# Altium schematic sheet Ultrascale+_02.SchDoc: Ultrascale+_02
size A3; Organization: Altium Limited; Address1: L3, 12a Rodborough Rd; Address2: Frenchs Forest; Address3: NSW; Address4: Australia 2086
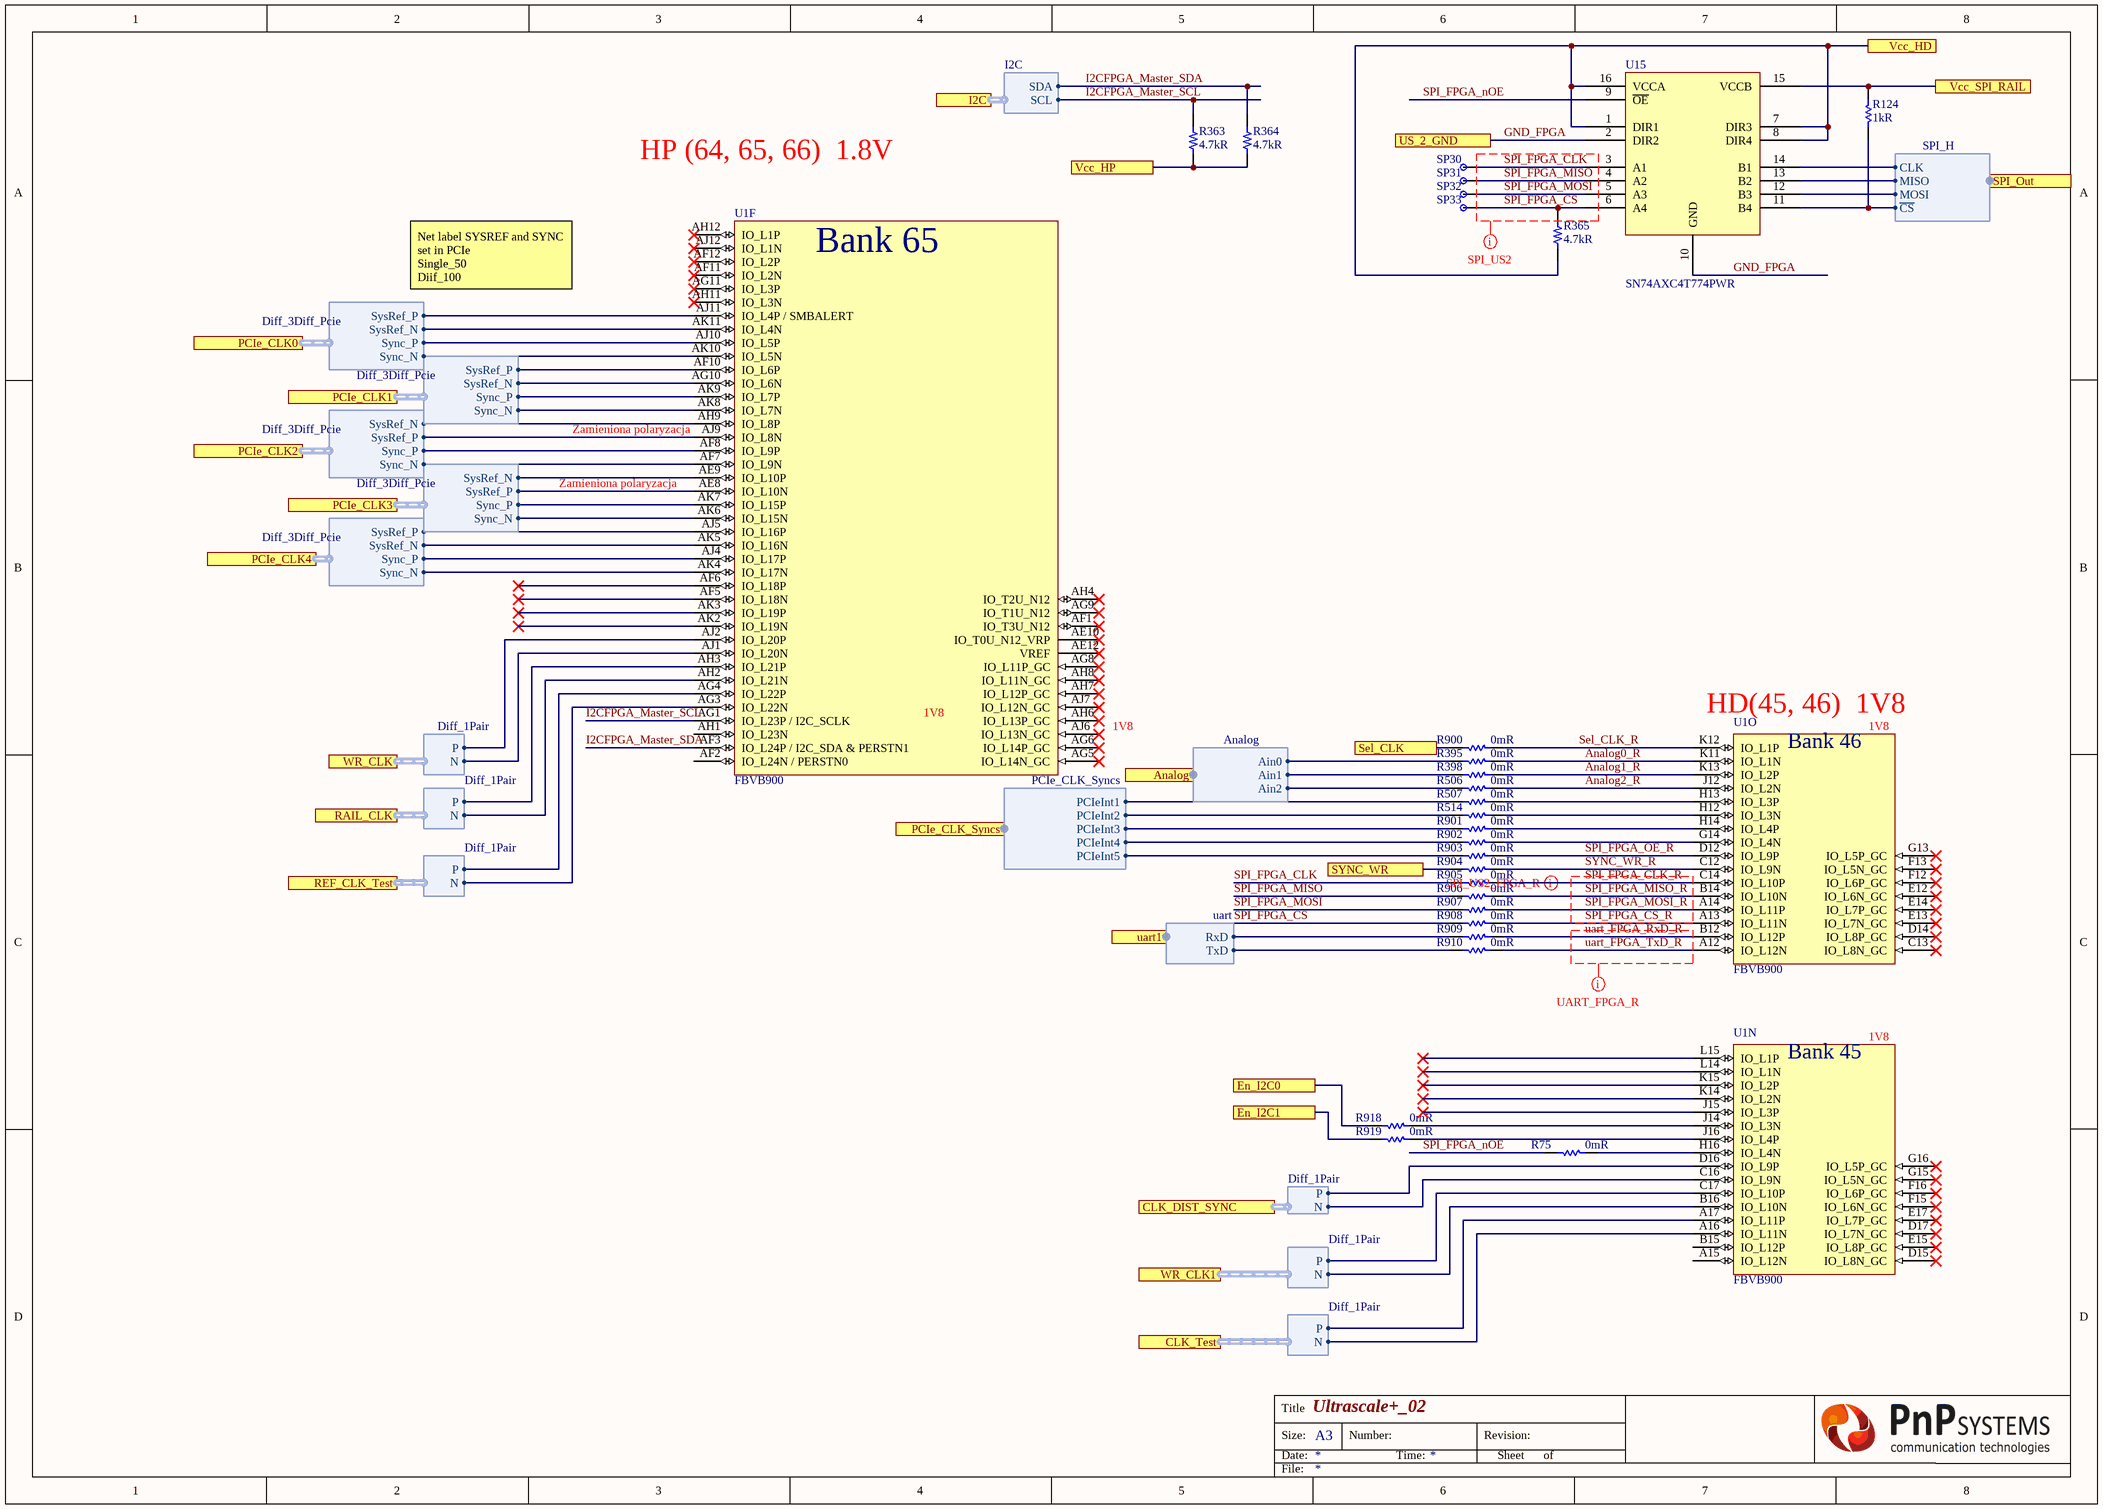
[diagram p0: Ultrascale+_02.SchDoc]

## Parts
R75  0mR  [RES 0402/1005 RF KK]
R124  1kR  [RES 0402/1005 RF KK]
R363  4.7kR  [RES 0402/1005 RF KK]
R364  4.7kR  [RES 0402/1005 RF KK]
R365  4.7kR  [RES 0402/1005 RF KK]
R395  0mR  [RES 0402/1005 RF KK]
R398  0mR  [RES 0402/1005 RF KK]
R506  0mR  [RES 0402/1005 RF KK]
R507  0mR  [RES 0402/1005 RF KK]
R514  0mR  [RES 0402/1005 RF KK]
R900  0mR  [RES 0402/1005 RF KK]
R901  0mR  [RES 0402/1005 RF KK]
R902  0mR  [RES 0402/1005 RF KK]
R903  0mR  [RES 0402/1005 RF KK]
R904  0mR  [RES 0402/1005 RF KK]
R905  0mR  [RES 0402/1005 RF KK]
R906  0mR  [RES 0402/1005 RF KK]
R907  0mR  [RES 0402/1005 RF KK]
R908  0mR  [RES 0402/1005 RF KK]
R909  0mR  [RES 0402/1005 RF KK]
R910  0mR  [RES 0402/1005 RF KK]
R918  0mR  [RES 0402/1005 RF KK]
R919  0mR  [RES 0402/1005 RF KK]
SP30  SP  [MeasureTP]  (value not drawn)
SP31  SP  [MeasureTP]  (value not drawn)
SP32  SP  [MeasureTP]  (value not drawn)
SP33  SP  [MeasureTP]  (value not drawn)
U1  FBVB900  [FBVB900 XX]  (parts F,N,O of 23)
U15  SN74AXC4T774PWR  [SN74AXC4T774PWR]

## Ports
Analog (harness Analog), CLK_DIST_SYNC (harness Diff_1Pair), CLK_Test (harness Diff_1Pair), En_I2C0, En_I2C1, I2C (harness I2C), PCIe_CLK0 (harness Diff_3Diff_Pcie), PCIe_CLK1 (harness Diff_3Diff_Pcie), PCIe_CLK2 (harness Diff_3Diff_Pcie), PCIe_CLK3 (harness Diff_3Diff_Pcie), PCIe_CLK4 (harness Diff_3Diff_Pcie), PCIe_CLK_Syncs (harness PCIe_CLK_Syncs), RAIL_CLK (harness Diff_1Pair), REF_CLK_Test (harness Diff_1Pair), Sel_CLK, SPI_Out (harness SPI_H), SYNC_WR, uart1 (harness uart), US_2_GND, Vcc_HD, Vcc_HP, Vcc_SPI_RAIL, WR_CLK1 (harness Diff_1Pair), WR_CLK (harness Diff_1Pair)

## Harnesses
I2C: SDA, SCL
uart: RxD, TxD
Diff_1Pair: N, P
Diff_1Pair: P, N
SPI_H: CLK, MISO, MOSI, ~{CS}
Analog: Ain0, Ain1, Ain2
PCIe_CLK_Syncs: PCIeInt1, PCIeInt2, PCIeInt3, PCIeInt4, PCIeInt5
Diff_3Diff_Pcie: SysRef_N, SysRef_P, Sync_P, Sync_N

## Nets
Analog0_R: R395.1 U1.K11(IO_L1N)
Analog1_R: R398.1 U1.K13(IO_L2P)
Analog2_R: R506.1 U1.J12(IO_L2N)
En_I2C0: R918.2 ; port En_I2C0
En_I2C1: R919.2 ; port En_I2C1
GND_FPGA: U15.2(DIR2) U15.10(GND) ; port US_2_GND
I2CFPGA_Master_SCL: R363.2 U1.AG1(IO_L23P_/_I2C_SCLK) ; port I2C.SCL
I2CFPGA_Master_SDA: R364.2 U1.AF3(IO_L24P_/_I2C_SDA_&_PERSTN1) ; port I2C.SDA
Sel_CLK: R900.2 ; port Sel_CLK
Sel_CLK_R: R900.1 U1.K12(IO_L1P)
SPI_FPGA_CLK: R905.2 SP30.1 U15.3(A1)
SPI_FPGA_CLK_R: R905.1 U1.C14(IO_L10P)
SPI_FPGA_CS: R365.2 R908.2 SP33.1 U15.6(A4)
SPI_FPGA_CS_R: R908.1 U1.A13(IO_L11N)
SPI_FPGA_MISO: R906.2 SP31.1 U15.4(A2)
SPI_FPGA_MISO_R: R906.1 U1.B14(IO_L10N)
SPI_FPGA_MOSI: R907.2 SP32.1 U15.5(A3)
SPI_FPGA_MOSI_R: R907.1 U1.A14(IO_L11P)
SPI_FPGA_nOE: R75.2 U15.9(~{OE})
SPI_FPGA_OE_R: R903.1 U1.D12(IO_L9P)
SYNC_WR: R904.2 ; port SYNC_WR
SYNC_WR_R: R904.1 U1.C12(IO_L9N)
uart_FPGA_RxD_R: R909.1 U1.B12(IO_L12P)
uart_FPGA_TxD_R: R910.1 U1.A12(IO_L12N)
Vcc_HD: R365.1 U15.1(DIR1) U15.7(DIR3) U15.8(DIR4) U15.16(VCCA) ; port Vcc_HD
Vcc_HP: R363.1 R364.1 ; port Vcc_HP
Vcc_SPI_RAIL: R124.2 U15.15(VCCB) ; port Vcc_SPI_RAIL
NetR75_1: R75.1 U1.H16(IO_L4N)
NetR124_1: R124.1 U15.11(B4) ; port SPI_Out.~{CS}
NetR395_2: R395.2 ; port Analog.Ain0
NetR398_2: R398.2 ; port Analog.Ain1
NetR506_2: R506.2 ; port Analog.Ain2
NetR507_1: R507.1 U1.H13(IO_L3P)
NetR507_2: R507.2 ; port PCIe_CLK_Syncs.PCIeInt1
NetR514_1: R514.1 U1.H12(IO_L3N)
NetR514_2: R514.2 ; port PCIe_CLK_Syncs.PCIeInt2
NetR901_1: R901.1 U1.H14(IO_L4P)
NetR901_2: R901.2 ; port PCIe_CLK_Syncs.PCIeInt3
NetR902_1: R902.1 U1.G14(IO_L4N)
NetR902_2: R902.2 ; port PCIe_CLK_Syncs.PCIeInt4
NetR903_2: R903.2 ; port PCIe_CLK_Syncs.PCIeInt5
NetR909_2: R909.2 ; port uart1.RxD
NetR910_2: R910.2 ; port uart1.TxD
NetR918_1: R918.1 U1.J14(IO_L3N)
NetR919_1: R919.1 U1.J16(IO_L4P)
NetU1_A16: U1.A16(IO_L11N) ; port CLK_Test.N
NetU1_A17: U1.A17(IO_L11P) ; port CLK_Test.P
NetU1_AE8: U1.AE8(IO_L10N) ; port PCIe_CLK3.SysRef_P
NetU1_AE9: U1.AE9(IO_L10P) ; port PCIe_CLK3.SysRef_N
NetU1_AF7: U1.AF7(IO_L9N) ; port PCIe_CLK2.Sync_N
NetU1_AF8: U1.AF8(IO_L9P) ; port PCIe_CLK2.Sync_P
NetU1_AF10: U1.AF10(IO_L6P) ; port PCIe_CLK1.SysRef_P
NetU1_AG3: U1.AG3(IO_L22N) ; port REF_CLK_Test.N
NetU1_AG4: U1.AG4(IO_L22P) ; port REF_CLK_Test.P
NetU1_AG10: U1.AG10(IO_L6N) ; port PCIe_CLK1.SysRef_N
NetU1_AH2: U1.AH2(IO_L21N) ; port RAIL_CLK.N
NetU1_AH3: U1.AH3(IO_L21P) ; port RAIL_CLK.P
NetU1_AH9: U1.AH9(IO_L8P) ; port PCIe_CLK2.SysRef_N
NetU1_AJ1: U1.AJ1(IO_L20N) ; port WR_CLK.N
NetU1_AJ2: U1.AJ2(IO_L20P) ; port WR_CLK.P
NetU1_AJ4: U1.AJ4(IO_L17P) ; port PCIe_CLK4.Sync_P
NetU1_AJ5: U1.AJ5(IO_L16P) ; port PCIe_CLK4.SysRef_P
NetU1_AJ9: U1.AJ9(IO_L8N) ; port PCIe_CLK2.SysRef_P
NetU1_AJ10: U1.AJ10(IO_L5P) ; port PCIe_CLK0.Sync_P
NetU1_AJ11: U1.AJ11(IO_L4P_/_SMBALERT) ; port PCIe_CLK0.SysRef_P
NetU1_AK4: U1.AK4(IO_L17N) ; port PCIe_CLK4.Sync_N
NetU1_AK5: U1.AK5(IO_L16N) ; port PCIe_CLK4.SysRef_N
NetU1_AK6: U1.AK6(IO_L15N) ; port PCIe_CLK3.Sync_N
NetU1_AK7: U1.AK7(IO_L15P) ; port PCIe_CLK3.Sync_P
NetU1_AK8: U1.AK8(IO_L7N) ; port PCIe_CLK1.Sync_N
NetU1_AK9: U1.AK9(IO_L7P) ; port PCIe_CLK1.Sync_P
NetU1_AK10: U1.AK10(IO_L5N) ; port PCIe_CLK0.Sync_N
NetU1_AK11: U1.AK11(IO_L4N) ; port PCIe_CLK0.SysRef_N
NetU1_B16: U1.B16(IO_L10N) ; port WR_CLK1.N
NetU1_C16: U1.C16(IO_L9N) ; port CLK_DIST_SYNC.N
NetU1_C17: U1.C17(IO_L10P) ; port WR_CLK1.P
NetU1_D16: U1.D16(IO_L9P) ; port CLK_DIST_SYNC.P
NetU15_12: U15.12(B3) ; port SPI_Out.MOSI
NetU15_13: U15.13(B2) ; port SPI_Out.MISO
NetU15_14: U15.14(B1) ; port SPI_Out.CLK

Not connected (* = marked no-connect by the designer): U1 A15(IO_L12N) AE10(IO_T0U_N12_VRP)* AE12(VREF)* AF1(IO_T3U_N12)* AF2(IO_L24N_/_PERSTN0) AF5(IO_L18N)* AF6(IO_L18P)* AF11(IO_L2N)* AF12(IO_L2P)* AG5(IO_L14N_GC)* AG6(IO_L14P_GC)* AG8(IO_L11P_GC)* AG9(IO_T1U_N12)* AG11(IO_L3P)* AH1(IO_L23N) AH4(IO_T2U_N12)* AH6(IO_L13P_GC)* AH7(IO_L12P_GC)* AH8(IO_L11N_GC)* AH11(IO_L3N)* AH12(IO_L1P)* AJ6(IO_L13N_GC)* AJ7(IO_L12N_GC)* AJ12(IO_L1N)* AK2(IO_L19N)* AK3(IO_L19P)* B15(IO_L12P) C13(IO_L8N_GC)* D14(IO_L8P_GC)* D15(IO_L8N_GC)* D17(IO_L7N_GC)* E12(IO_L6N_GC)* E13(IO_L7N_GC)* E14(IO_L7P_GC)* E15(IO_L8P_GC)* E17(IO_L7P_GC)* F12(IO_L6P_GC)* F13(IO_L5N_GC)* F15(IO_L6N_GC)* F16(IO_L6P_GC)* G13(IO_L5P_GC)* G15(IO_L5N_GC)* G16(IO_L5P_GC)* J15(IO_L3P)* K14(IO_L2N)* K15(IO_L2P)* L14(IO_L1N)* L15(IO_L1P)*

## Layout directives
net class SPI_US2_R: SPI_FPGA_CLK, SPI_FPGA_CS, SPI_FPGA_MISO, SPI_FPGA_MOSI
net class SPI_US2_FPGA_R: SPI_FPGA_CLK_R
net class UART_FPGA_R: uart_FPGA_RxD_R, uart_FPGA_TxD_R

## Notes on the sheet
- HP (64, 65, 66)  1.8V
- Net label SYSREF and SYNC set in PCIe
  Single_50
  Diif_100
- (near U1) Zamieniona polaryzacja
- (near U1) 1V8
- (near U1) HD(45, 46)  1V8
- 1V8
- Title
- Size:
- Date:
- A3
- Number:
- Time:
- Revision:
- Sheet
- of
- File:
- (in symbol FBVB900, part F) Bank 65
- (in symbol FBVB900, part N) Bank 45
- (in symbol FBVB900, part O) Bank 46

## Library data of the parts
R75 R395 R398 R506 R507 R514 R900-R910 R918 R919 = Resistor: Manufacturer 1: Yageo; Manufacturer Part Number 1: RC0402JR-070RL; Power Rating: 62.5mW; Tolerance: 5%; Voltage Rating: 50V; Max Power Dissipation: 63mW; Temperature Coefficient: 200ppm/°C; Supplier 1: Digi-Key; Supplier Part Number 1: 311-0.0JRCT-ND; Stock 1: 69822252; Pricing 1: 1=0.10000, 10=0.01200, 25=0.00920, 50=0.00680, 100=0.00510, 250=0.00388, 500=0.00308, 1000=0.00227, 5000=0.00163 (USD); RoHS: Yes; Case/Package: 0402; Contact Plating: Tin,Matte; Case Code (Metric): 1005; Case Code (Imperial): 0402; Min Operating Temperature: -55°C; Max Operating Temperature: 155°C; Resistance: 0mR; Packaging: Tape and Reel; Composition: Thick Film; Package Quantity: 1; Number of Terminations: 2; Termination: SMD/SMT; Military Standard: Not; Features: Moisture Resistant; Length: 1mm; Height: 0.016inch; Width: 0.02inch; Depth: 0.5mm; Radiation Hardening: No; REACH SVHC: Unknown; Lead Free: Lead Free; ComponentLink1URL: https://datasheet.ciiva.com/2452/pyu-rc0402-51-rohs-l-6-2452608.pdf?src-supplier=Digi-Key; ComponentLink1Description: https://datasheet.ciiva.com/2452/pyu-rc0402-51-rohs-l-6-2452608.pdf?src-supplier=Digi-Key; ComponentLink2URL: https://datasheet.ciiva.com/11808/0900766b80c66297-11808195.pdf?src-supplier=RSComponents; ComponentLink2Description: https://datasheet.ciiva.com/11808/0900766b80c66297-11808195.pdf?src-supplier=RSComponents; ComponentLink3URL: https://datasheet.ciiva.com/2452/pyu-r-int-thick-7-2452609.pdf?src-supplier=Digi-Key; ComponentLink3Description: https://datasheet.ciiva.com/2452/pyu-r-int-thick-7-2452609.pdf?src-supplier=Digi-Key; ComponentLink4URL: https://datasheet.ciiva.com/22747/1018594-22747515.pdf?src-supplier=Element14; ComponentLink4Description: https://datasheet.ciiva.com/22747/1018594-22747515.pdf?src-supplier=Element14; ComponentLink5URL: https://datasheet.ciiva.com/7983/1018594-7983535.pdf?src-supplier=Element14; ComponentLink5Description: https://datasheet.ciiva.com/7983/1018594-7983535.pdf?src-supplier=Element14; ComponentLink6URL: https://datasheet.ciiva.com/2452/pyu-r-int-thick-7-2452610.pdf?src-supplier=Digi-Key; ComponentLink6Description: https://datasheet.ciiva.com/2452/pyu-r-int-thick-7-2452610.pdf?src-supplier=Digi-Key; ComponentLink7URL: https://datasheet.ciiva.com/8896/pyu-rc0402-51-rohs-l-6-8896201.pdf?src-supplier=Avnet; ComponentLink7Description: https://datasheet.ciiva.com/8896/pyu-rc0402-51-rohs-l-6-8896201.pdf?src-supplier=Avnet; ComponentLink8URL: https://datasheet.ciiva.com/28386/pyu-rc0402-51-rohs-l-6-28386633.pdf?src-supplier=Avnet+Europe; ComponentLink8Description: https://datasheet.ciiva.com/28386/pyu-rc0402-51-rohs-l-6-28386633.pdf?src-supplier=Avnet+Europe; ComponentLink9URL: https://datasheet.ciiva.com/15189/getdatasheetpartid-326379-15189533.pdf?src-supplier=Verical; ComponentLink9Description: https://datasheet.ciiva.com/15189/getdatasheetpartid-326379-15189533.pdf?src-supplier=Verical
R124 = Resistor: PANASONIC - ERJ-2RKF1001X - SMD Chip Resistor, 0402 [1005 Metric], 1 kohm, ERJ2R Series, 50 V, Thick Film, 100 mW; Temperature Coefficient: 100ppm/°C; Tolerance: 1%; Voltage Rating (DC): 50V; Power Rating: 100mW; Supplier 1: Digi-Key; Supplier Part Number 1: P1.00KLDKR-ND; Manufacturer: Panasonic; Manufacturer Part Number: ERJ-2RKF1001X; RoHS: Yes; Category: Chip SMD Resistors; Stock 1: 1864188; Pricing 1: 1=0,10000, 10=0,04300, 100=0,01740, 1000=0,00782, 2500=0,00678, 5000=0,00561 (USD); Mount: Surface Mount; Case/Package: 0402; Number of Pins: 2; Contact Plating: Tin; Case Code (Imperial): 0402; Case Code (Metric): 1005; Min Operating Temperature: -55°C; Max Operating Temperature: 155°C; Composition: Thick Film; Resistance: 1kR; Termination: SMD/SMT; Number of Terminations: 2; Military Standard: Not; Features: Automotive AEC-Q200; Packaging: Tape and Reel; Voltage Rating: 50V; Package Quantity: 1; Max Power Dissipation: 100mW; Working Voltage: 50V; Length: 1mm; Height: 0.35mm; Depth: 0.5mm; Width: 0.5mm; Radiation Hardening: No; Lead Free: Lead Free; REACH SVHC: No SVHC; ComponentLink1URL: https://datasheet.ciiva.com/11821/0900766b80f80784-11821203.pdf?src-supplier=RSComponents; ComponentLink1Description: https://datasheet.ciiva.com/11821/0900766b80f80784-11821203.pdf?src-supplier=RSComponents; ComponentLink2URL: https://datasheet.ciiva.com/7942/aoa0000ce2-7942426.pdf?src-supplier=Element14; ComponentLink2Description: https://datasheet.ciiva.com/7942/aoa0000ce2-7942426.pdf?src-supplier=Element14; ComponentLink3URL: https://datasheet.ciiva.com/16523/aoa0000ce2-16523834.pdf?src-supplier=Avnet+Asia; ComponentLink3Description: https://datasheet.ciiva.com/16523/aoa0000ce2-16523834.pdf?src-supplier=Avnet+Asia; ComponentLink4URL: https://datasheet.ciiva.com/17215/aoa0000ce2-17215308.pdf?src-supplier=Avnet+Europe; ComponentLink4Description: https://datasheet.ciiva.com/17215/aoa0000ce2-17215308.pdf?src-supplier=Avnet+Europe; ComponentLink5URL: https://datasheet.ciiva.com/22673/1678782-22673916.pdf?src-supplier=Element14; ComponentLink5Description: https://datasheet.ciiva.com/22673/1678782-22673916.pdf?src-supplier=Element14; ComponentLink6URL: https://datasheet.ciiva.com/28532/1678782-28532109.pdf?src-supplier=Element14; ComponentLink6Description: https://datasheet.ciiva.com/28532/1678782-28532109.pdf?src-supplier=Element14; ComponentLink7URL: https://datasheet.ciiva.com/16767/70260748-16767559.pdf?src-supplier=Allied+Electronics; ComponentLink7Description: https://datasheet.ciiva.com/16767/70260748-16767559.pdf?src-supplier=Allied+Electronics; ComponentLink8URL: https://datasheet.ciiva.com/9198/aoa0000ce2-9198920.pdf?src-supplier=Avnet; ComponentLink8Description: https://datasheet.ciiva.com/9198/aoa0000ce2-9198920.pdf?src-supplier=Avnet; ComponentLink9URL: https://datasheet.ciiva.com/16771/70260748-16771979.pdf?src-supplier=Allied+Electronics; ComponentLink9Description: https://datasheet.ciiva.com/16771/70260748-16771979.pdf?src-supplier=Allied+Electronics
R363-R365 = Resistor: Manufacturer: Panasonic; Manufacturer Part Number: ERJ-2RKF4701X; Tolerance: 1%; Temperature Coefficient: 100ppm/°C; Power Rating: 100mW; Voltage Rating: 50V; Supplier 1: Digi-Key; Supplier Part Number 1: P4.70KLCT-ND; Stock 1: 5361977; Pricing 1: 1 = 0,10000, 10 = 0,05500, 100 = 0,02250, 1000 = 0,01009, 2500 = 0,00876, 5000 = 0,00724 (USD); RoHS: Yes; Mount: Surface Mount; Case/Package: 0402; Number of Pins: 2; Case Code (Imperial): 0402; Case Code (Metric): 1005; Contact Plating: Tin; Min Operating Temperature: -55°C; Max Operating Temperature: 155°C; Resistance: 4.7kR; Packaging: Tape and Reel; Composition: Thick Film; Package Quantity: 1; Termination: SMD/SMT; Voltage Rating (DC): 50V; Number of Terminations: 2; Military Standard: Not; Max Power Dissipation: 100mW; Features: Automotive AEC-Q200; Length: 1mm; Height: 0.35mm; Width: 0.02inch; Depth: 0.5mm; Radiation Hardening: No; Lead Free: Lead Free; REACH SVHC: No SVHC; ComponentLink1URL: https://datasheet.ciiva.com/11821/0900766b80f80784-11821329.pdf?src-supplier=RSComponents; ComponentLink1Description: https://datasheet.ciiva.com/11821/0900766b80f80784-11821329.pdf?src-supplier=RSComponents; ComponentLink2URL: https://datasheet.ciiva.com/30053/aoa0000ce2-30053990.pdf?src-supplier=Onlinecomponents.com; ComponentLink2Description: https://datasheet.ciiva.com/30053/aoa0000ce2-30053990.pdf?src-supplier=Onlinecomponents.com; ComponentLink3URL: https://datasheet.ciiva.com/7830/aoa0000ce2-7830727.pdf?src-supplier=Element14; ComponentLink3Description: https://datasheet.ciiva.com/7830/aoa0000ce2-7830727.pdf?src-supplier=Element14; ComponentLink4URL: https://datasheet.ciiva.com/22781/1678782-22781576.pdf?src-supplier=Farnell; ComponentLink4Description: https://datasheet.ciiva.com/22781/1678782-22781576.pdf?src-supplier=Farnell; ComponentLink5URL: https://datasheet.ciiva.com/9195/aoa0000ce2-9195737.pdf?src-supplier=Avnet; ComponentLink5Description: https://datasheet.ciiva.com/9195/aoa0000ce2-9195737.pdf?src-supplier=Avnet; ComponentLink6URL: https://datasheet.ciiva.com/17213/aoa0000ce2-17213180.pdf?src-supplier=Avnet+Europe; ComponentLink6Description: https://datasheet.ciiva.com/17213/aoa0000ce2-17213180.pdf?src-supplier=Avnet+Europe; ComponentLink7URL: https://datasheet.ciiva.com/22667/1678782-22667886.pdf?src-supplier=Element14; ComponentLink7Description: https://datasheet.ciiva.com/22667/1678782-22667886.pdf?src-supplier=Element14; ComponentLink8URL: https://datasheet.ciiva.com/16763/70260748-16763151.pdf?src-supplier=Allied+Electronics; ComponentLink8Description: https://datasheet.ciiva.com/16763/70260748-16763151.pdf?src-supplier=Allied+Electronics; ComponentLink9URL: https://datasheet.ciiva.com/22723/1678782-22723903.pdf?src-supplier=Element14; ComponentLink9Description: https://datasheet.ciiva.com/22723/1678782-22723903.pdf?src-supplier=Element14; ComponentLink10URL: https://datasheet.ciiva.com/24025/aoa0000ce2-24025663.pdf?src-supplier=Mouser; ComponentLink10Description: https://datasheet.ciiva.com/24025/aoa0000ce2-24025663.pdf?src-supplier=Mouser
U1 = FBVB900: FPGA Zynq UltraScale+ Family 192150 Cells 20nm Technology 0.85V 900-Pin FCBGA Tray; Manufacturer Part Number: XCZU4CG-1FBVB900E; Manufacturer: Xilinx; Peripherals: WDT,DMA; Interface: I2C,SPI,USB,Ethernet,MMC,SDIO,SD,UART,USART,EBI/EMI; Core Architecture: ARM; RAM Size: 256KB; Frequency: 500MHz; Number of I/Os: 204; Supplier 1: Mouser; Supplier Part Number 1: 217-CZU4CG-1FBVB900E; Stock 1: 3; Pricing 1: 1=0,00000, 5=1060,70000 (USD); RoHS: No; Case/Package: FCBGA; Min Operating Temperature: 0°C; Max Operating Temperature: 100°C; Packaging: Tray; ComponentLink1URL: https://www.xilinx.com/support/documentation/data_sheets/ds891-zynq-ultrascale-plus-overview.pdf?src-supplier=Digi-Key; ComponentLink1Description: https://www.xilinx.com/support/documentation/data_sheets/ds891-zynq-ultrascale-plus-overview.pdf?src-supplier=Digi-Key; ComponentLink2URL: https://www.xilinx.com/support/documentation/data_sheets/ds925-zynq-ultrascale-plus.pdf?src-supplier=Digi-Key; ComponentLink2Description: https://www.xilinx.com/support/documentation/data_sheets/ds925-zynq-ultrascale-plus.pdf?src-supplier=Digi-Key; Supplier 2: Avnet; Supplier 3: Digi-Key; Supplier Part Number 2: XCZU4CG-1FBVB900E; Supplier Part Number 3: XCZU4CG-1FBVB900E-ND
U15 = SN74AXC4T774PWR: Manufacturer 1: Texas Instruments; Supplier 1: Digi-Key; Manufacturer Part Number 1: SN74AXC4T774PWR; Stock 1: 2000; Pricing 1: 1=1,14000, 10=1,01500, 100=0,79120, 500=0,65364, 1000=0,51603 (USD); RoHS: No; Supplier Part Number 1: 296-SN74AXC4T774PWRCT-ND